# EAGLE schematic Amp_Master_Schematic_rev1 (EAGLE 9.7.0)
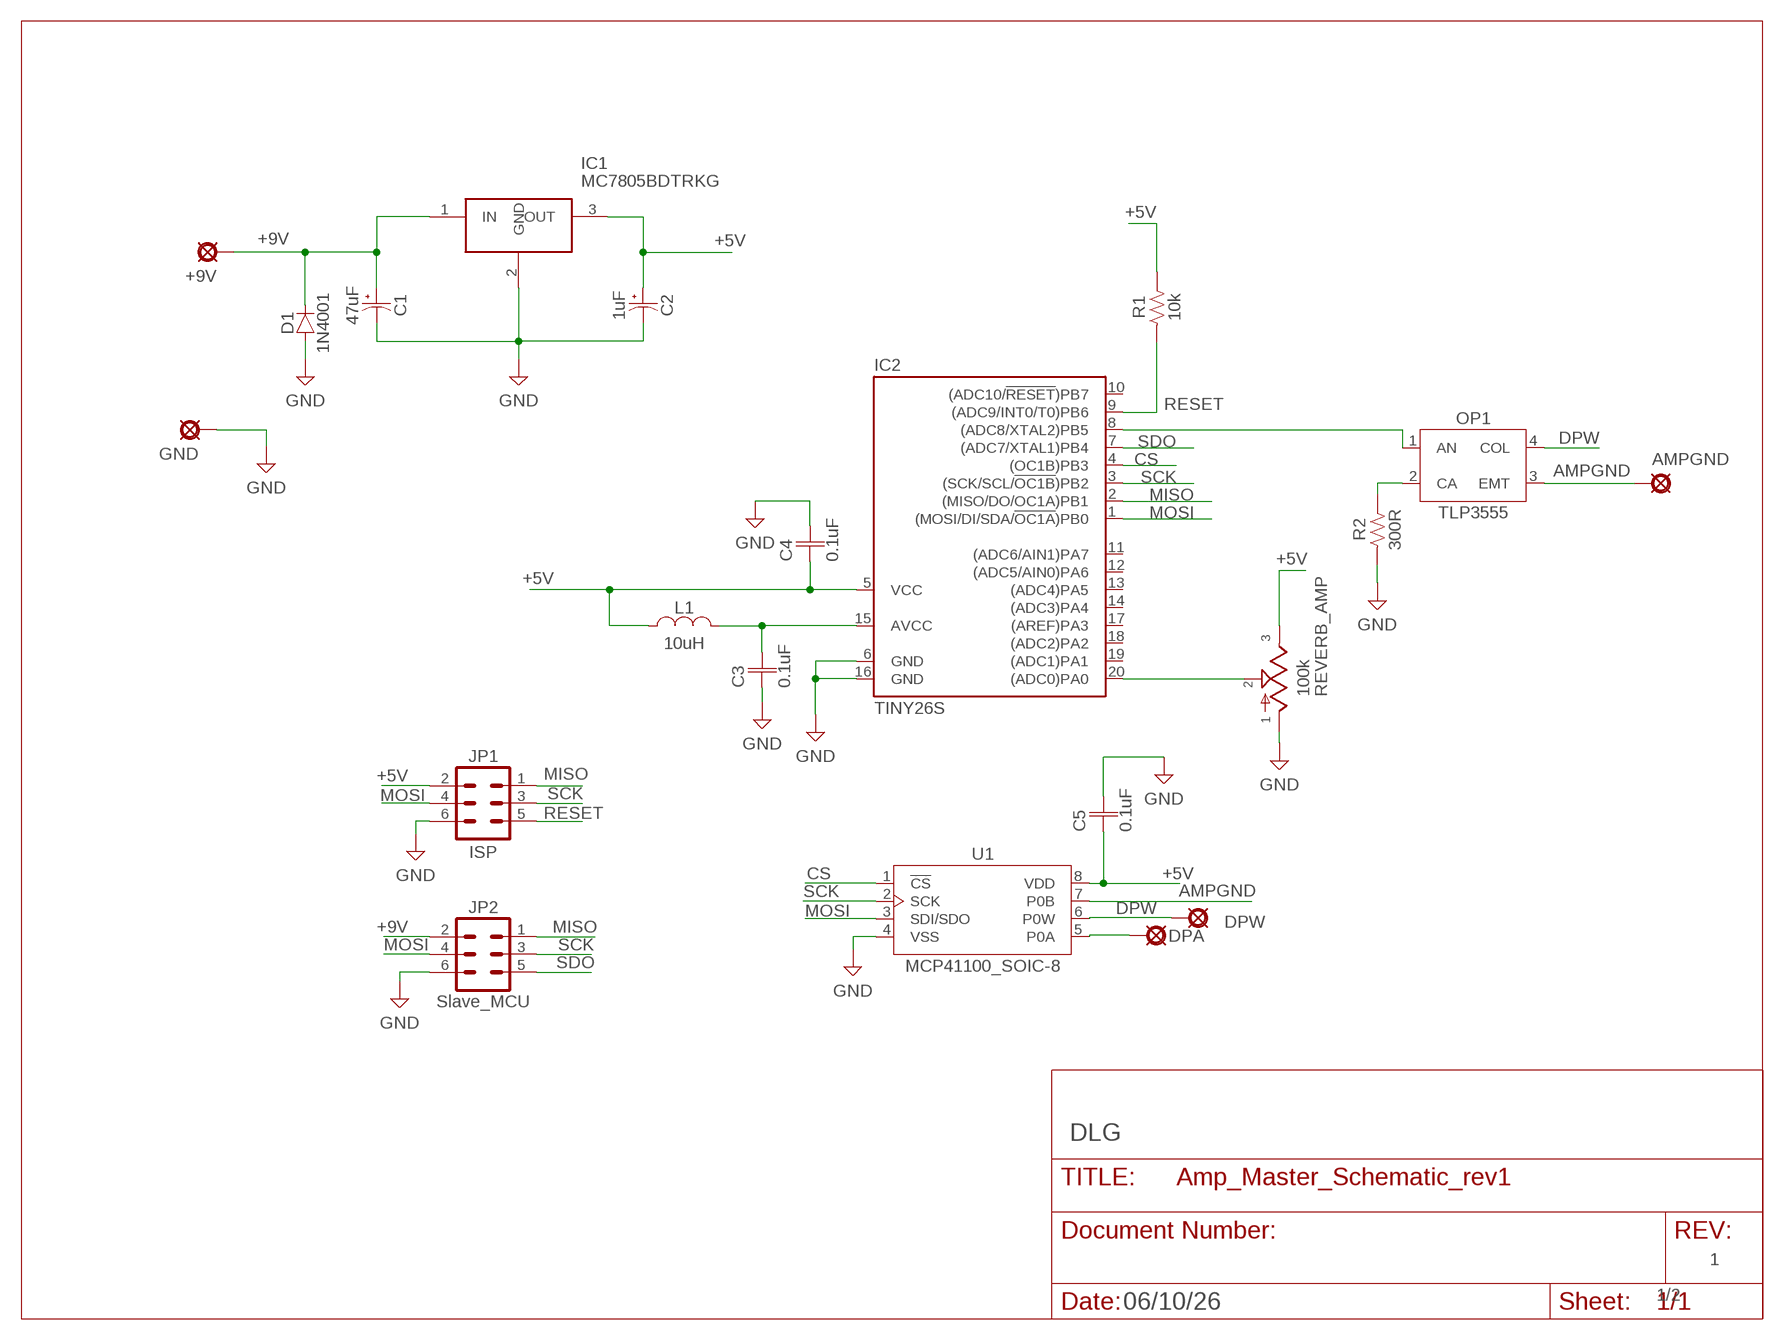
[diagram p0: schematic, sheet 1]
FRAME1 (LETTER_L): AUTHOR: DLG; DATE: 06/10/26; REV: 1; SHEETNUMBER: 1/2

## Parts
+9V  PADSQUARE_20AWG  [SQUARE_0.813MM]
AMPGND  PADSQUARE_20AWG  [SQUARE_0.813MM]
C1  47uF  C-POL-USECAP-4MM  [CAPAE430X430N]
C2  1uF  C-POL-USECAP-4MM  [CAPAE430X430N]
C3  0.1uF  C_CHIP-1206(3216-METRIC)  [CAPC3216X135]
C4  0.1uF  C_CHIP-1206(3216-METRIC)  [CAPC3216X135]
C5  0.1uF  C_CHIP-1206(3216-METRIC)  [CAPC3216X135]
D1  1N4001  DIODE_ES1D_SMA  [DIOM5226X290N]
DPA  PADSQUARE_20AWG  [SQUARE_0.813MM]
DPW  PADSQUARE_20AWG  [SQUARE_0.813MM]
GND  PADSQUARE_20AWG  [SQUARE_0.813MM]
IC1  MC7805BDTRKG  [LM317MADTRKG]
IC2  TINY26S  [SO20L]
JP1  ISP  CONN_03X22MM_PITCH  [2X3-SHROUDED]
JP2  Slave_MCU  CONN_03X22MM_PITCH  [2X3-SHROUDED]
L1  10uH  L_CHIP-1206(3216-METRIC)  [INDC3216X190]
OP1  TLP3555  FOD817BSDDIP4  [DIP4]
R1  10k  R-US_CHIP-1206(3216-METRIC)  [RESC3216X70]
R2  300R  R-US_CHIP-1206(3216-METRIC)  [RESC3216X70]
REVERB_AMP  100k  POTPCB  [16MM-PCB-MOUNT]
U1  MCP41100_SOIC-8  MCP4131-103E/SN_SOIC-8  [SOIC127P600X175-8N]

## Nets
+5V [Power]: C2.1(+) C4.1 C5.1 IC1.3(OUT) IC2.5(VCC) JP1.2 L1.1 R1.2 REVERB_AMP.3 U1.8(VDD)
+5V1: C3.2 IC2.15(AVCC) L1.2
+9V [Power]: +9V.1(PAD) C1.1(+) D1.1(C) IC1.1(IN) JP2.2
AMPGND [Audio Signal]: AMPGND.1(PAD) OP1.3(EMT) U1.7(P0B)
CS: IC2.4((OC1B)PB3) U1.1(!CS)
DPW [Audio Signal]: DPW.1(PAD) OP1.4(COL) U1.6(P0W)
GND [Power]: C1.2(-) C2.2(-) C3.1 C4.2 C5.2 D1.2(A) GND.1(PAD) IC1.2(GND) IC2.6(GND) IC2.16(GND) JP1.6 JP2.6 R2.1 REVERB_AMP.1 U1.4(VSS)
MISO: IC2.2((MISO/DO/OC1A)PB1) JP1.1 JP2.1
MOSI: IC2.1((MOSI/DI/SDA/!OC1A!)PB0) JP1.4 JP2.4 U1.3(SDI/SDO)
N$1: IC2.20((ADC0)PA0) REVERB_AMP.2
N$2: IC2.8((ADC8/XTAL2)PB5) OP1.1(AN)
N$3: OP1.2(CA) R2.2
N$6 [Audio Signal]: DPA.1(PAD) U1.5(P0A)
RESET: IC2.9((ADC9/INT0/T0)PB6) JP1.5 R1.1
SCK: IC2.3((SCK/SCL/!OC1B!)PB2) JP1.3 JP2.3 U1.2(SCK)
SDO: IC2.7((ADC7/XTAL1)PB4) JP2.5
Unconnected: IC2.10((ADC10/!RESET!)PB7) IC2.11((ADC6/AIN1)PA7) IC2.12((ADC5/AIN0)PA6) IC2.13((ADC4)PA5) IC2.14((ADC3)PA4) IC2.17((AREF)PA3) IC2.18((ADC2)PA2) IC2.19((ADC1)PA1)

## Library data of the parts
+9V AMPGND DPA DPW GND = gm-supply:PAD: PAD use this package for pads with any purpose, including input, output, send or return various pad shapes: round, square, octogonal, long, and long offset
C1 C2 = Capacitor:C-POL-US: Capacitor Polarised - ANSI; CATEGORY_L1: Capacitor; CATEGORY_L2: Aluminum Electrolytic Capacitors; CATEGORY_L3: Radial Can; DESCRIPTION: ECAP (Aluminum Electrolytic Capacitor), 0.157" Dia (4.00mm) body Size, 0.217" (5.50mm) Height - Seated (Max), 0.169" L x 0.169" W (4.30mm x 4.30mm) Surface Mount Land Size; PACKAGE: Surface Mount
C3-C5 = Capacitor:C: Capacitor - Generic; CATEGORY_L1: Capacitor; CATEGORY_L2: Ceramic Capacitors; CATEGORY_L3: MLCC; PACKAGE: Surface Mount; PACKAGE_SIZE: 1206
D1 = Diode:DIODE_: Diode Rectifier - Popular Parts; CATEGORY_L1: Diodes; CATEGORY_L2: Rectifiers; CATEGORY_L3: Ultra Fast Recovery Rectifiers; DATASHEET: https://www.onsemi.com/download/data-sheet/pdf/es1d-d.pdf; DESCRIPTION: Diode 200 V 1A Surface Mount DO-214AC (SMA); FORWARD_CURRENT: 1A; FORWARD_VOLTAGE: 920mV; MANUFACTURER: onsemi; MPN: ES1D; OPERATING_TEMPERATURE: -55°C ~ 150°C; PACKAGE: Surface Mount; PART_STATUS: Active; REVERSE_VOLTAGE: 200V; ROHS: Compliant; SERIES: ES1D
IC1 = MC7805BDTRKG:MC7805BDTRKG: Output Current in Excess of 1.0 A; No External Components Required; Internal Thermal Overload Protection; Internal Short Circuit Current Limiting; Output Transistor Safe-Area Compensation; Output Voltage Offered in 2% and 4% Tolerance; Pb-Free Packages are Available Source: Datasheet <https://www.onsemi.com/pub/Collateral/MC7800-D.PDF>; DESCRIPTION: Output Current in Excess of 1.0 A; No External Components Required; Internal Thermal Overload Protection; Internal Short Circuit Current Limiting; Output Transistor Safe-Area Compensation; Output Voltage Offered in 2% and 4% Tolerance; Pb-Free Packages are Available; HEIGHT: 2.38mm; MANUFACTURER_NAME: onsemi; MANUFACTURER_PART_NUMBER: MC7805BDTRKG; MOUSER_PART_NUMBER: 863-MC7805BDTRKG; MOUSER_PRICE-STOCK: https://www.mouser.co.uk/ProductDetail/onsemi/MC7805BDTRKG?qs=%252B9%2Fcbd0IE0RVSCV5SBH6%2FA%3D%3D
IC2 = atmel:TINY26*: 8-bit AVR Microcontroller with 2K Bytes Flash Source: http://www.atmel.com .. doc1477.pdf; MPN: ATTINY261-20SU; OC_FARNELL: 1455147; OC_NEWARK: 58M3783
JP1 JP2 = SparkFun-Connectors:CONN_03X2: Multi connection point. Often used as Generic Header-pin footprint for 0.1 inch spaced/style header connections You can populate with any combo of single row headers, but if you'd like an exact match, check these: Header - 2x3 (Male, 0.1") <https://www.sparkfun.com/products/12807> (PRT-12807) Header - 2x3 (Female, 0.1") <https://www.sparkfun.com/products/13010> (PRT-13010) 2x3 Pin Shrouded Header <https://www.sparkfun.com/products/10877> (PRT-10877) On any of the 0.1 inch spaced packages, you can populate with these: Break Away Headers - Straight <https://www.sparkfun.com/products/116> (PRT-00116) Break Away Male Headers - Right Angle <https://www.sparkfun.com/products/553> (PRT-00553) Female Headers <https://www.sparkfun.com/products/115> (PRT-00115) Break Away Headers - Machine Pin <https://www.sparkfun.com/products/117> (PRT-00117) Break Away Female Headers - Swiss Machine Pin <https://www.sparkfun.com/products/743> (PRT-00743) Special note: the shrouded connector mates well with our 3x2 ribbon cables: Ribbon Crimp Connector - 6-pin (2x3, Female) <https://www.sparkfun.com/products/10651> (PRT-10651) Ribbon Cable - 6 wire (15ft) <https://www.sparkfun.com/products/10646> (PRT-10646); PROD_ID: CONN-14886
L1 = Inductor:L: Inductor Fixed - Generic; CATEGORY_L1: Inductors; DESCRIPTION: Chip 3.20 X 1.60 X 1.90 mm body 1206(3216-METRIC); PACKAGE: Surface Mount; PACKAGE_SIZE: 1206
OP1 = Opto-Electronic:FOD817BSD: 4-Pin DIP Phototransistor Optocouplers; CATEGORY_L1: Optoelectronics; CATEGORY_L2: Optocouplers; CATEGORY_L3: Transistor Photovoltaic Output Optoisolators; DATASHEET: https://www.onsemi.com/pdf/datasheet/fod814-d.pdf; MANUFACTURER: onsemi
R1 R2 = Resistor:R-US: Resistor Fixed - ANSI; CATEGORY_L1: Resistors; DESCRIPTION: Chip Resistor 3.20 X 1.60 X 0.70 mm body 1206(3216-METRIC) Package; PACKAGE: Surface Mount; PACKAGE_SIZE: 1206
REVERB_AMP = gm-pots:POT: Potentiometers the arrow indicates the clockwise motion of th wiper (lug 2) fully counter clockwise there is no resistance between lugs 1 and 2 fully clockwise the resistance between lugs 1 and 2 is the value of the pot
U1 = IC_Data-Conversion:MCP41*: 7/8-Bit Single/Dual SPI Digital POT with Volatile Memory Reference: Datasheet <http://ww1.microchip.com/downloads/en/devicedoc/22060b.pdf>; CATEGORY_L1: Data Conversion IC; CATEGORY_L2: Data Acquisition; CATEGORY_L3: Digital Potentiometers; DATASHEET: https://ww1.microchip.com/downloads/en/DeviceDoc/22060b.pdf; DESCRIPTION: Digital Potentiometer 10k Ohm 1 Circuit 129 Taps SPI Interface 8-SOIC; MANUFACTURER: Microchip Technology; MPN: MCP4131-103E/SN; OPERATING_TEMPERATURE: -40°C ~ 125°C; PACKAGE: Surface Mount; PACKAGE_SIZE: 8-SOIC; PART_STATUS: Active; ROHS: Compliant; SERIES: MCP41X; THERMALLOSS: 0.4 W

## Net classes
1 Power: width 0.6 mm
2 Audio Signal: width 0.254 mm